# EAGLE design tranc_3b (EAGLE 6.5.0)
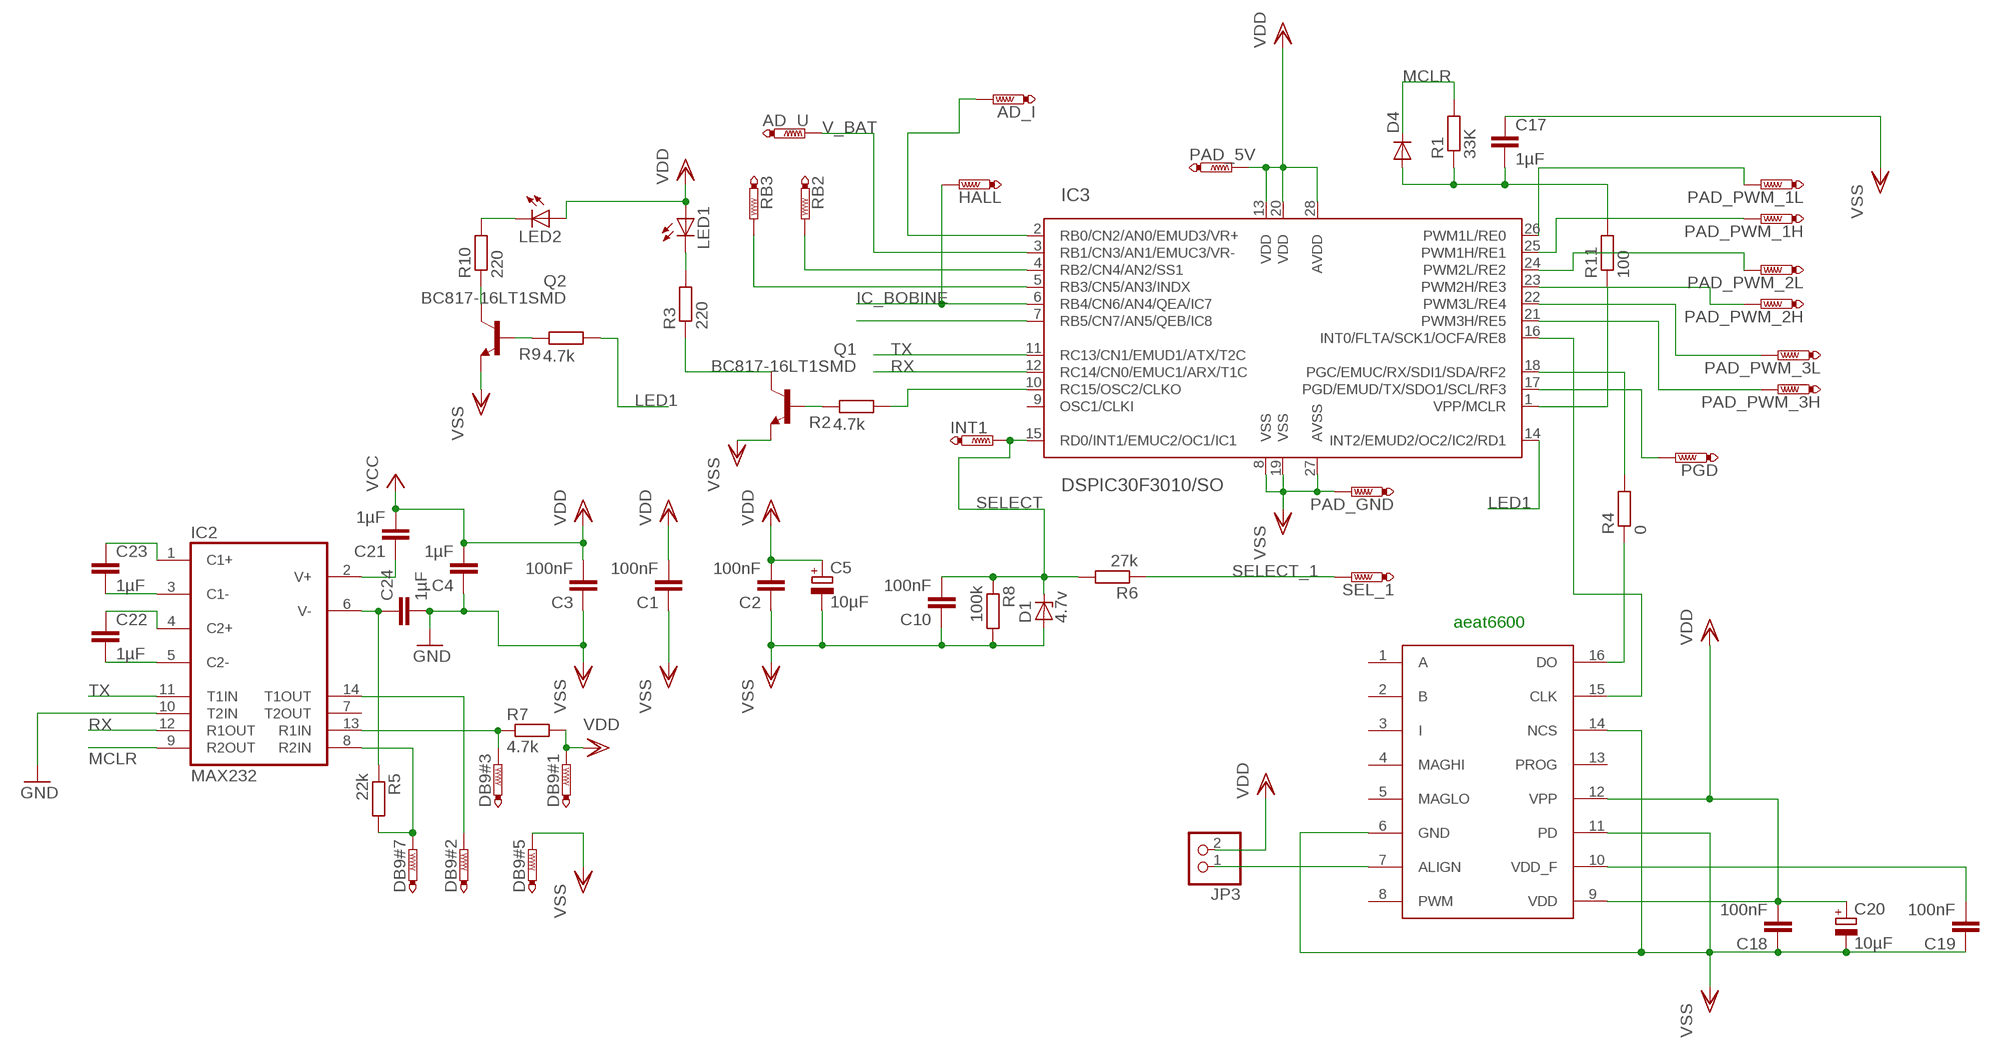
[diagram p0: schematic, sheet 1]

## Parts
AD_I  PTR1TP20SQ  [TP20SQ]
AD_U  PTR1TP20SQ  [TP20SQ]
C1  100nF  C-EUC0805K  [C0805K]
C2  100nF  C-EUC0805K  [C0805K]
C3  100nF  C-EUC0805K  [C0805K]
C4  1µF  C-EUC0805K  [C0805K]
C5  10µF  CPOL-EUSMCB  [SMC_B]
C10  100nF  C-EUC0805K  [C0805K]
C17  1µF  C-EUC0805K  [C0805K]
C18  100nF  C-EUC0805K  [C0805K]
C19  100nF  C-EUC0805K  [C0805K]
C20  10µF  CPOL-EUSMCB  [SMC_B]
C21  1µF  C-EUC0805K  [C0805K]
C22  1µF  C-EUC0805K  [C0805K]
C23  1µF  C-EUC0805K  [C0805K]
C24  1µF  C-EUC0805K  [C0805K]
D1  4.7v  ZENER-DIODESOD80C  [SOD80C]
D4  DIODE-MINIMELF  [MINIMELF]
DB9#1  PTR1TP20SQ  [TP20SQ]
DB9#2  PTR1TP20SQ  [TP20SQ]
DB9#3  PTR1TP20SQ  [TP20SQ]
DB9#5  PTR1TP20SQ  [TP20SQ]
DB9#7  PTR1TP20SQ  [TP20SQ]
HALL  PTR1TP20SQ  [TP20SQ]
IC2  MAX232  [SO16]
IC3  DSPIC30F3010/SO  [SO-28W]
INT1  PTR1TP16SQ  [TP16SQ]
JP3  PINHD-1X2  [1X02]
LED1  LEDCHIPLED_1206  [CHIPLED_1206]
LED2  LEDCHIPLED_1206  [CHIPLED_1206]
PAD_5V  PTR1TP20SQ  [TP20SQ]
PAD_GND  PTR1TP20SQ  [TP20SQ]
PAD_PWM_1H  PTR1TP20SQ  [TP20SQ]
PAD_PWM_1L  PTR1TP20SQ  [TP20SQ]
PAD_PWM_2H  PTR1TP08R  [TP08R]
PAD_PWM_2L  PTR1TP08R  [TP08R]
PAD_PWM_3H  PTR1TP08R  [TP08R]
PAD_PWM_3L  PTR1TP08R  [TP08R]
PGD  PTR1TP10SQ  [TP10SQ]
Q1  BC817-16LT1SMD  [SOT23-BEC]
Q2  BC817-16LT1SMD  [SOT23-BEC]
R1  33K  R-EU_M1206  [M1206]
R2  4.7k  R-EU_M0805  [M0805]
R3  220  R-EU_M0805  [M0805]
R4  0  R-EU_R0805W  [R0805W]
R5  22k  R-EU_M1206  [M1206]
R6  27k  R-EU_M1206  [M1206]
R7  4.7k  R-EU_M1206  [M1206]
R8  100k  R-EU_M0805  [M0805]
R9  4.7k  R-EU_M0805  [M0805]
R10  220  R-EU_M0805  [M0805]
R11  100  R-EU_M0805  [M0805]
RB2  PTR1TP10SQ  [TP10SQ]
RB3  PTR1TP10SQ  [TP10SQ]
SEL_1  PTR1TP20SQ  [TP20SQ]
U$3  AVAGO_AEAT-6600TSSOP16  [AVAGO_TSSOP16]

## Nets
IC_BOBINE: HALL.TP IC3.6(RB4/CN6/AN4/QEA/IC7)
LED1: IC3.14(INT2/EMUD2/OC2/IC2/RD1) R9.1
MCLR: D4.C IC2.9(R2OUT) R1.2
MCLR1: IC3.1(VPP/MCLR) R11.1
N$1: R4.1 U$3.16(DO)
N$2: IC3.21(PWM3H/RE5) PAD_PWM_3H.TP
N$3: IC3.16(INT0/FLTA/SCK1/OCFA/RE8) U$3.15(CLK)
N$4: IC3.22(PWM3L/RE4) PAD_PWM_3L.TP
N$5: Q1.B R2.2
N$6: Q1.C R3.1
N$7: IC3.7(RB5/CN7/AN5/QEB/IC8)
N$9: C17.2 D4.A R1.1 R11.2
N$10: IC3.23(PWM2H/RE3) PAD_PWM_2H.TP
N$11: IC3.25(PWM1H/RE1) PAD_PWM_1H.TP
N$12: IC3.26(PWM1L/RE0) PAD_PWM_1L.TP
N$13: IC3.24(PWM2L/RE2) PAD_PWM_2L.TP
N$14: JP3.1 U$3.7(ALIGN)
N$15: IC3.17(PGD/EMUD/TX/SDO1/SCL/RF3) PGD.TP
N$17: IC3.18(PGC/EMUC/RX/SDI1/SDA/RF2) R4.2
N$18: IC3.10(RC15/OSC2/CLKO) R2.1
N$19: IC3.5(RB3/CN5/AN3/INDX) RB3.TP
N$20: IC3.4(RB2/CN4/AN2/SS1) RB2.TP
N$21: Q2.B R9.2
N$22: Q2.C R10.1
N$23: LED1.C R3.2
N$24: LED2.C R10.2
N$27: C23.1 IC2.1(C1+)
N$28: C23.2 IC2.3(C1-)
N$29: C22.2 IC2.5(C2-)
N$30: AD_I.TP IC3.2(RB0/CN2/AN0/EMUD3/VR+)
N$31: C19.2 U$3.10(VDD_F)
N$32: C22.1 IC2.4(C2+)
N$33: C21.1 IC2.2(V+)
N$34: C24.1 IC2.6(V-) R5.1
N$35: DB9#3.TP IC2.13(R1IN) R7.1
N$36: DB9#2.TP IC2.14(T1OUT)
N$37: DB9#7.TP IC2.8(R2IN) R5.2
RX: IC2.12(R1OUT) IC3.12(RC14/CN0/EMUC1/ARX/T1C)
SELECT: C10.2 D1.C IC3.15(RD0/INT1/EMUC2/OC1/IC1) INT1.TP R6.2 R8.1
SELECT_1: R6.1 SEL_1.TP
TX: IC2.11(T1IN) IC3.11(RC13/CN1/EMUD1/ATX/T2C)
V_BAT: AD_U.TP IC3.3(RB1/CN3/AN1/EMUC3/VR-)
VDD: C1.2 C2.2 C3.2 C4.2 C5.+ C18.2 C20.+ C21.2 DB9#1.TP IC3.13(VDD) IC3.20(VDD) IC3.28(AVDD) JP3.2 LED1.A LED2.A PAD_5V.TP R7.2 U$3.9(VDD) U$3.12(VPP) ; supply symbol labelled VCC
VSS: C1.1 C2.1 C3.1 C4.1 C5.- C10.1 C17.1 C18.1 C19.1 C20.- C24.2 D1.A DB9#5.TP IC2.10(T2IN) IC3.8(VSS) IC3.19(VSS) IC3.27(AVSS) PAD_GND.TP Q1.E Q2.E R8.2 U$3.6(GND) U$3.11(PD) U$3.14(NCS) ; supply symbol labelled GND
Unconnected: IC2.7(T2OUT) IC3.9(OSC1/CLKI) U$3.1(A) U$3.2(B) U$3.3(I) U$3.4(MAGHI) U$3.5(MAGLO) U$3.8(PWM) U$3.13(PROG)

## Notes on the sheet
- aeat6600

## Power pins joined to a net without a drawn wire
VDD: IC2.16(VCC)
VSS: IC2.15(GND)

## Library data of the parts
AD_I AD_U DB9#1-DB9#3 DB9#5 DB9#7 HALL INT1 PAD_5V PAD_GND PAD_PWM_1H PAD_PWM_1L PAD_PWM_2H PAD_PWM_2L PAD_PWM_3H PAD_PWM_3L PGD RB2 RB3 SEL_1 = testpad:PTR1: TEST PIN
C1-C4 C10 C17-C19 C21-C24 = rcl:C-EU: CAPACITOR, European symbol
C5 C20 = rcl:CPOL-EU: POLARIZED CAPACITOR, European symbol
D1 = diode:ZENER-DIODE: Z-Diode
D4 = diode:DIODE-: DIODE
IC2 = maxim:MAX232: RS232 TRANSCEIVER
IC3 = microchip-dspic:DSPIC30F3010: dsPIC Motion Controller DSC
JP3 = pinhead:PINHD-1X2: PIN HEADER
LED1 LED2 = led:LED: LED OSRAM: - CHIPLED LG R971, LG N971, LY N971, LG Q971, LY Q971, LO R971, LY R971 LH N974, LH R974 LS Q976, LO Q976, LY Q976 LO Q996 - Hyper CHIPLED LW Q18S LB Q993, LB Q99A, LB R99A - SideLED LS A670, LO A670, LY A670, LG A670, LP A670 LB A673, LV A673, LT A673, LW A673 LH A674 LY A675 LS A676, LA A676, LO A676, LY A676, LW A676 LS A679, LY A679, LG A679 - Hyper Micro SIDELED® LS Y876, LA Y876, LO Y876, LY Y876 LT Y87S - SmartLED LW L88C, LW L88S LB L89C, LB L89S, LG L890 LS L89K, LO L89K, LY L89K LS L896, LA L896, LO L896, LY L896 - TOPLED LS T670, LO T670, LY T670, LG T670, LP T670 LSG T670, LSP T670, LSY T670, LOP T670, LYG T670 LG T671, LOG T671, LSG T671 LB T673, LV T673, LT T673, LW T673 LH T674 LS T676, LA T676, LO T676, LY T676, LB T676, LH T676, LSB T676, LW T676 LB T67C, LV T67C, LT T67C, LS T67K, LO T67K, LY T67K, LW E67C LS E67B, LA E67B, LO E67B, LY E67B, LB E67C, LV E67C, LT E67C LW T67C LS T679, LY T679, LG T679 LS T770, LO T770, LY T770, LG T770, LP T770 LB T773, LV T773, LT T773, LW T773 LH T774 LS E675, LA E675, LY E675, LS T675 LS T776, LA T776, LO T776, LY T776, LB T776 LHGB T686 LT T68C, LB T68C - Hyper Mini TOPLED® LB M676 - Mini TOPLED Santana® LG M470 LS M47K, LO M47K, LY M47K Source: http://www.osram.convergy.de LUXEON: - LUMILED® LXK2-PW12-R00, LXK2-PW12-S00, LXK2-PW14-U00, LXK2-PW14-V00 LXK2-PM12-R00, LXK2-PM12-S00, LXK2-PM14-U00 LXK2-PE12-Q00, LXK2-PE12-R00, LXK2-PE12-S00, LXK2-PE14-T00, LXK2-PE14-U00 LXK2-PB12-K00, LXK2-PB12-L00, LXK2-PB12-M00, LXK2-PB14-N00, LXK2-PB14-P00, LXK2-PB14-Q00 LXK2-PR12-L00, LXK2-PR12-M00, LXK2-PR14-Q00, LXK2-PR14-R00 LXK2-PD12-Q00, LXK2-PD12-R00, LXK2-PD12-S00 LXK2-PH12-R00, LXK2-PH12-S00 LXK2-PL12-P00, LXK2-PL12-Q00, LXK2-PL12-R00 Source: www.luxeon.com KINGBRIGHT: KA-3528ASYC Source: www.kingbright.com
Q1 Q2 = transistor-npn:BC817*: NPN Transistor
R1-R11 = rcl:R-EU_: RESISTOR, European symbol
U$3 = aeat_6600_1:AVAGO_AEAT-6600

## Board
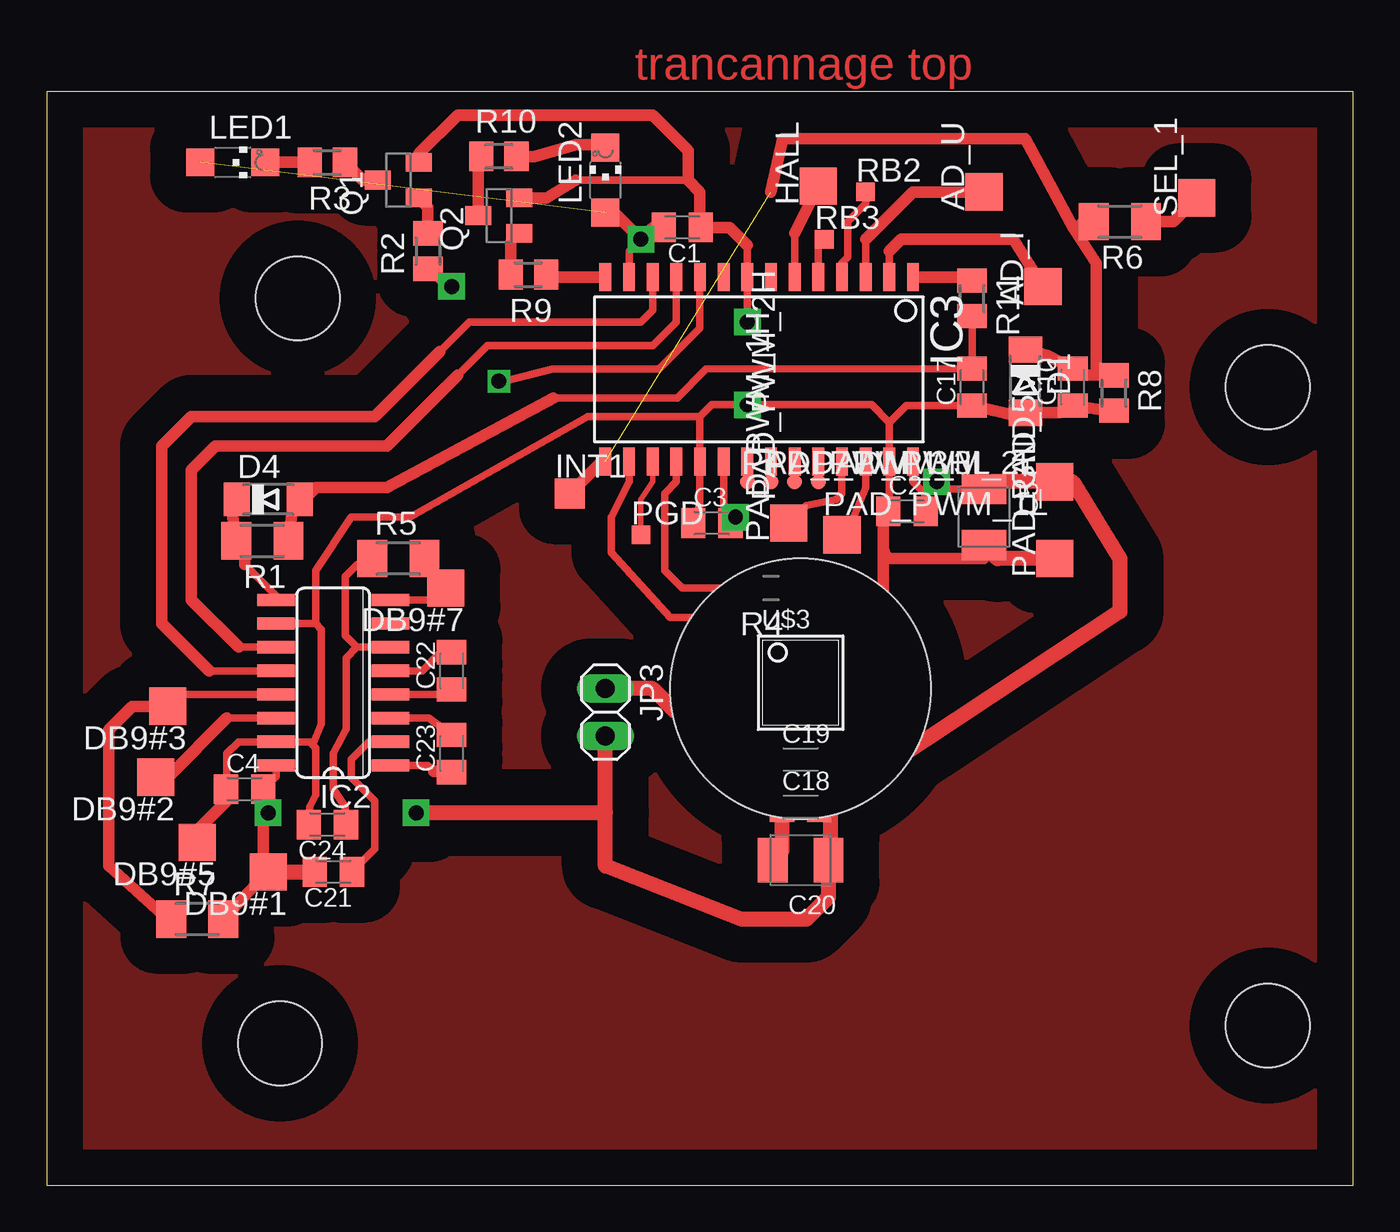
[diagram p1: board, top side]
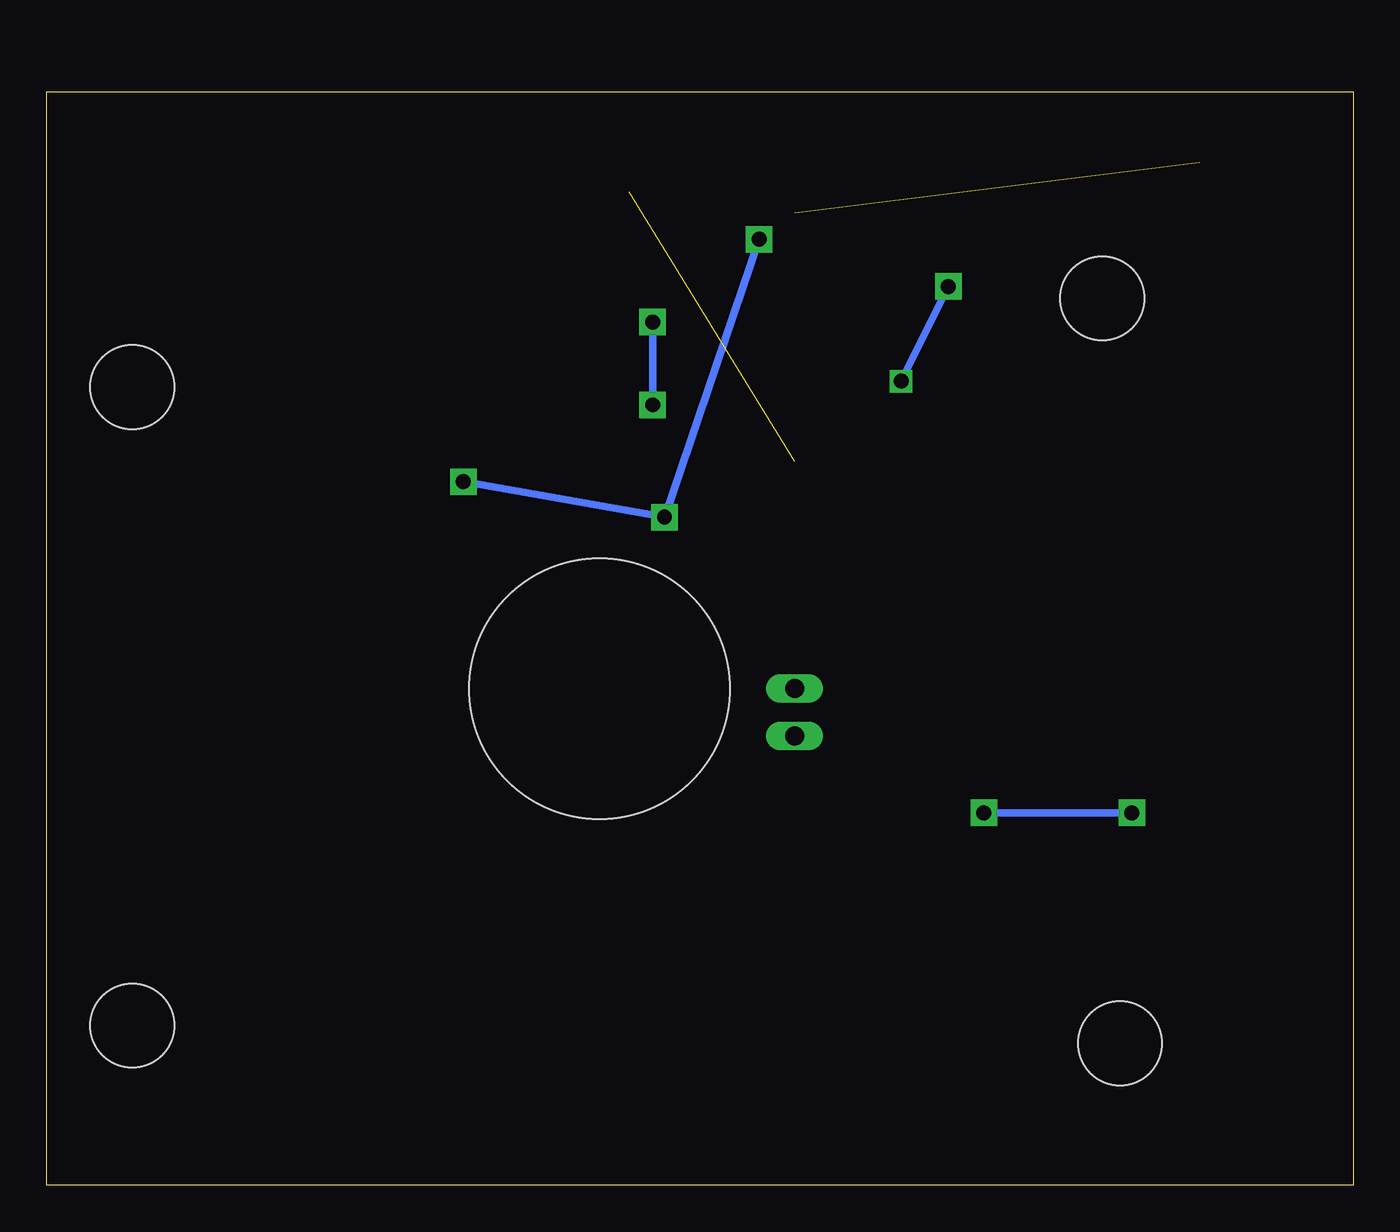
[diagram p2: board, bottom side, seen from below]

Size 70.16 x 58.73 mm. Coordinates in mm from the lower left corner, seen from the top.
Outline: 0,0 70.16,0 70.16,58.73 0,58.73 0,0
Copper layers (1*16): Top 0.035mm / dielectric 1.5mm / Bottom 0.035mm
Design rules "default": minimum track width 10mil, minimum drill 24mil, track to track 8mil, track to pad 8mil, pad to pad 8mil, via to via 8mil, smd to smd 8mil, copper to edge 40mil, drill to drill 8mil, minimum pad ring 10mil, minimum via ring 8mil, stop-mask expansion 4mil, vias tented up to drill 0mil, thermal gap 10mil
Holes 14 mm at 40.48,26.66
Holes 4.5 mm at 13.49,47.62 65.56,42.86 12.54,7.62 65.56,8.57

### Footprints (pad centres in the part's own frame; a part is rotated, then mirrored left to right if it is on the bottom)
TP20SQ = smd 2 x 2: TP 0,0
C0805K = smd 1.3 x 1.6: 1 -1,0; 2 1,0
SMC_B = smd 1.6 x 2.4: + -1.5,0; - 1.5,0
SOD80C = smd 1.4 x 1.8: A 1.7,0; C -1.7,0
MINIMELF = smd 1.4 x 1.8: A 1.7,0; C -1.7,0
SO16 = smd 0.66 x 2.032: 1 -4.445,-3.073; 2 -3.175,-3.073; 3 -1.905,-3.073; 4 -0.635,-3.073; 5 0.635,-3.073; 6 1.905,-3.073; 7 3.175,-3.073; 8 4.445,-3.073; 9 4.445,3.073; 10 3.175,3.073; 11 1.905,3.073; 12 0.635,3.073; 13 -0.635,3.073; 14 -1.905,3.073; 15 -3.175,3.073; 16 -4.445,3.073
SO-28W = smd 0.635 x 1.524: 1 -7.62,-4.953; 2 -6.35,-4.953; 3 -5.08,-4.953; 4 -3.81,-4.953; 5 -2.54,-4.953; 6 -1.27,-4.953; 7 0,-4.953; 8 1.27,-4.953; 9 2.54,-4.953; 10 3.81,-4.953; 11 5.08,-4.953; 12 6.35,-4.953; 13 7.62,-4.953; 14 8.89,-4.953; 15 8.89,4.953; 16 7.62,4.953; 17 6.35,4.953; 18 5.08,4.953; 19 3.81,4.953; 20 2.54,4.953; 21 1.27,4.953; 22 0,4.953; 23 -1.27,4.953; 24 -2.54,4.953; 25 -3.81,4.953; 26 -5.08,4.953; 27 -6.35,4.953; 28 -7.62,4.953
TP16SQ = smd 1.6 x 1.6: TP 0,0
1X02 = drill 1.016 long: 1 -1.27,0; 2 1.27,0
CHIPLED_1206 = smd 1.5 x 1.5: A 0,-1.75; C 0,1.75
TP08R = smd 0.8 x 0.8: TP 0,0
TP10SQ = smd 1 x 1: TP 0,0
SOT23-BEC = smd 1 x 1.4: B -0.95,-1.1; C 0,1.1; E 0.95,-1.1
M1206 = smd 1.6 x 2: 1 -1.4,0; 2 1.4,0
M0805 = smd 1.3 x 1.6: 1 -0.95,0; 2 0.95,0
R0805W = smd 1.5 x 1: 1 -1.052,0; 2 1.052,0
AVAGO_TSSOP16 = smd 0.305 x 0.991: 1 -2.275,-2.918; 2 -1.625,-2.918; 3 -0.975,-2.918; 4 -0.325,-2.918; 5 0.325,-2.918; 6 0.975,-2.918; 7 1.625,-2.918; 8 2.275,-2.918; 9 2.275,2.918; 10 1.625,2.918; 11 0.975,2.918; 12 0.325,2.918; 13 -0.325,2.918; 14 -0.975,2.918; 15 -1.625,2.918; 16 -2.275,2.918

### Placement (x,y rotation side)
AD_I  53.49,48.26 90 top
AD_U  50.32,53.34 90 top
C1  34.12,51.43 180 top
C2  46.19,36.19 0 top
C3  35.71,35.55 0 top
C4  10.63,21.27 0 top
C5  50.32,35.87 270 top
C10  55.08,42.86 90 top
C17  49.68,42.86 90 top
C18  40.48,20.32 0 top
C19  40.48,22.86 0 top
C20  40.48,17.46 180 top
C21  15.39,16.82 180 top
C22  21.74,27.62 90 top
C23  21.74,23.17 90 top
C24  15.08,19.36 180 top
D1  52.54,43.17 270 top
D4  11.9,36.83 0 top
DB9#1  11.9,16.82 180 top
DB9#2  5.87,21.9 180 top
DB9#3  6.5,25.71 180 top
DB9#5  8.09,18.41 180 top
DB9#7  21.42,32.06 180 top
HALL  41.43,53.65 90 top
IC2  15.39,26.98 90 top
IC3  38.89,43.81 180 top
INT1  28.09,37.14 0 top
JP3  30,25.39 270 top
LED1  10,54.92 270 top
LED2  30,53.97 0 top
PAD_5V  54.13,37.78 90 top
PAD_GND  54.13,33.65 90 top
PAD_PWM_1H  39.84,35.55 90 top
PAD_PWM_1L  42.7,34.92 0 top
PAD_PWM_2H  40.16,37.78 90 top
PAD_PWM_2L  41.43,37.78 0 top
PAD_PWM_3H  37.62,37.78 0 top
PAD_PWM_3L  38.89,37.78 0 top
PGD  31.9,34.92 0 top
Q1  18.88,53.97 90 top
Q2  24.28,52.06 90 top
R1  11.58,34.6 180 top
R2  20.47,50.16 90 top
R3  15.08,54.92 180 top
R4  38.89,32.06 180 top
R5  18.88,33.65 0 top
R6  57.62,51.75 180 top
R7  8.09,14.28 0 top
R8  57.3,42.54 270 top
R9  25.87,48.89 180 top
R10  24.28,55.24 0 top
R11  49.68,47.62 270 top
RB2  43.97,53.34 0 top
RB3  41.74,50.8 0 top
SEL_1  61.75,53.02 90 top
U$3  40.48,26.98 270 top

### Tracks (layer width: path | path; a pad name or v marks a point on that pad's centre or on a via)
IC_BOBINE
  Top 0.406: IC3.6 40.16,51.11
  Top 0.61: 40.16,51.11 HALL.TP
LED1
  Top 0.61: IC3.14 26.95,48.76 R9.1
MCLR
  Top 0.406: 10,35.88 10,36.83 10,36.62 D4.C | IC2.9 12.32,31.64 10.63,33.33 | 10.63,34.6 R1.2
  Top 0.61: R1.2 10,35.88 | 10.63,33.33 10.63,34.6
MCLR1
  Top 0.406: 49.49,48.76 R11.1
  Top 0.61: IC3.1 49.49,48.76
N$1
  Top 0.406: R4.1 40.59,32.06 U$3.16
N$2
  Top 0.406: PAD_PWM_3H.TP IC3.21
N$3
  Top 0.254: U$3.15 41.07,28.61 40.79,28.89
  Top 0.406: 40.79,28.89 39.2,30.48 33.49,30.48 30.31,33.97 30.31,35.87 31.27,37.78 IC3.16
N$4
  Top 0.406: PAD_PWM_3L.TP IC3.22
N$5
  Top 0.61: R2.2 20.47,52.53 Q1.B
N$6
  Top 0.61: Q1.C 16.98,53.97 R3.1
N$8
  pour Top (isolate 1.93): 0.47,58.73 70.32,58.73 70.32,0.31 0.15,0.31
N$9
  Top 0.406: R11.2 C17.2 35.39,43.81 33.85,42.27 27.19,42.27 | 12.58,34.65 R1.1 | 13.17,35.99 D4.A 13.81,36.83
  Top 0.61: R1.1 13.17,35.99 | 27.19,42.27 18.25,37.46 14.44,37.46 13.81,36.83
N$10
  Top 0.406: PAD_PWM_2H.TP IC3.23
N$11
  Top 0.406: IC3.25 42.7,37.14 42.38,36.83 40.79,36.51 PAD_PWM_1H.TP
N$12
  Top 0.406: IC3.26 43.97,37.46 43.33,35.87 PAD_PWM_1L.TP
N$13
  Top 0.406: PAD_PWM_2L.TP IC3.24
N$14
  Top 0.254: U$3.7 35.43,25.36 35.39,25.39
  Top 0.406: 35.39,25.39 33.81,25.39
  Top 0.813: 33.81,25.39 32.54,26.66 JP3.1
N$15
  Top 0.305: IC3.17 32.54,37.78 31.9,36.83 PGD.TP 31.9,34.6
N$17
  Top 0.406: R4.2 34.12,32.06 33.17,33.02 33.17,37.14 33.81,37.78 IC3.18
N$18  (via drill 0.8, 0.8 pad 1.42)
  Top 0.406: IC3.10 35.08,46.03 32.85,43.81 27.14,43.81 24.6,43.17 v24.28,43.17 | v21.74,48.26 21.43,48.26 R2.1
  Bottom 0.406: v24.28,43.17 v21.74,48.26
N$19
  Top 0.406: IC3.5 41.43,50.48 RB3.TP
N$20
  Top 0.406: IC3.4 42.7,49.52 43.02,49.84 43.02,51.75 43.97,52.7 RB2.TP
N$21
  Top 0.406: 24.92,50.65 Q2.B
  Top 0.61: R9.2 24.92,50.65
N$22
  Top 0.406: 23.18,55.09 R10.1
  Top 0.61: Q2.C 23.18,55.09
N$23
  Top 0.61: R3.2 LED1.C
N$24
  Top 0.406: 29.84,55.88 LED2.C
  Top 0.61: R10.2 26.19,55.24 28.41,55.88 29.84,55.88
N$27
  Top 0.406: IC2.1 20.47,22.54 20.79,22.22 | 22.01,22.22 C23.1
  Top 0.61: 20.79,22.22 22.01,22.22
N$28
  Top 0.406: IC2.3 20.52,25.08 C23.2
N$29
  Top 0.406: IC2.5 20.15,27.62 21.11,28.57 22.01,28.57 C22.2
N$30
  Top 0.406: IC3.2 45.24,50.16
  Top 0.61: 45.24,50.16 45.87,50.8 51.91,50.8 AD_I.TP
N$31
  Top 0.254: U$3.10 42.34,25.36 41.43,24.44
  Top 0.406: 41.43,24.44 41.43,22.9 C19.2
N$32
  Top 0.406: IC2.4 22.06,26.35 C22.1
N$33
  Top 0.406: 16.34,16.77 C21.1 17.61,18.05 17.61,20.63 16.34,21.9 16.34,22.86 17.3,23.81 IC2.2
N$34
  Top 0.406: C24.1 16.03,20.32 15.39,21.27 15.39,23.17 16.07,24.49 16.07,28.3 16.66,28.89 | 16.66,28.89 IC2.6 | R5.1 16.66,33.34 16.03,32.7 16.03,29.52 16.66,28.89
N$35
  Top 0.406: IC2.13 7.14,26.35 DB9#3.TP
  Top 0.61: R7.1 6.5,14.28 3.33,17.14 3.33,24.44 4.6,25.71 DB9#3.TP
N$36
  Top 0.406: IC2.14 9.68,25.08 | 6.5,21.9 DB9#2.TP
  Top 0.61: 9.68,25.08 6.5,21.9
N$37
  Top 0.406: IC2.8 21.42,31.43 DB9#7.TP 20.29,33.2 R5.2
RX
  Top 0.406: IC2.12 8.73,27.62 | 21.11,44.76 22.7,46.35 31.9,46.35 32.54,46.98 IC3.12
  Top 0.61: 8.73,27.62 6.18,30.16 6.18,39.68 7.77,41.27 17.61,41.27 21.11,44.76
SELECT  (1 unrouted)
  Top 0.406: 55.4,43.49 54.81,43.49 C10.2 | R6.2 55.52,51.75 55.13,51.36
  Top 0.61: R8.1 56.35,43.49 | 56.35,43.49 55.4,43.49 | D1.C 53.74,44.56 C10.2 | 38.89,53.34 39.52,56.19 52.54,56.19 55.13,51.36 56.35,49.52 56.35,43.49 | IC3.15 29.81,38.86 INT1.TP
SELECT_1
  Top 0.61: R6.1 60.48,51.75 SEL_1.TP
TX
  Top 0.406: IC3.11 33.81,46.35 32.54,45.08 23.65,45.08 22.06,43.49 | 10.31,28.89 IC2.11
  Top 0.61: 22.06,43.49 18.25,39.68 9.04,39.68 7.77,38.41 7.77,31.43 10.31,28.89
V_BAT
  Top 0.406: IC3.3 43.97,50.8
  Top 0.61: 43.97,50.8 46.51,53.34 AD_U.TP
VDD  (via drill 0.8 pad 1.42)  (1 unrouted)
  Top 0.254: U$3.9 43.97,24.71 44.55,24.71 44.92,25.08 44.92,26.35 44.6,26.66 U$3.12
  Top 0.406: IC2.16 12.32,21.96 C4.2 11.63,20.32 11.95,20 v11.9,20 | 11.63,17.09 DB9#1.TP | C18.2 42.06,20.63 | 43.49,21.43 43.65,21.59 43.65,24.39 43.97,24.71 | IC3.20 36.35,36.55 C3.2 v36.98,35.87 | 42.06,17.86 C20.+ | 32.54,51.43 C1.2 | 50.72,37.78 C5.+ 47.78,37.37 | IC3.13 31.27,50.16 v31.9,50.8 | IC3.28 46.51,37.78 47.14,37.14 | 47.14,37.14 47.14,36.24 C2.2 | 47.78,37.37 47.37,37.37 47.14,37.14 | v47.78,37.78 47.78,37.37 | PAD_5V.TP 55.08,37.78
  Top 0.61: 11.63,20.32 11.63,17.09 | 32.54,51.43 v31.9,50.8 30.16,52.54 LED2.A | R7.2 11.26,16.18 DB9#1.TP
  Top 0.813: DB9#1.TP C21.2 | 43.49,21.43 42.06,20.63 42.06,17.86 | PAD_5V.TP 50.72,37.78 | C20.+ 41.98,15.46 40.79,14.28 37.3,14.28 30,17.14 30,20 | 30,20 JP3.2 | 30,20 v19.84,20 | 55.08,37.78 57.62,33.65 57.62,30.79 43.65,21.59
  Bottom 0.406: v19.84,20 v11.9,20 | v31.9,50.8 v36.98,35.87 v47.78,37.78
VSS  (via drill 0.8 pad 1.42)
  Top 0.254: U$3.11 41.43,26.01 | 41.43,26.01 39.84,26.01 U$3.6 | 41.43,26.01 41.43,27.3 42.09,27.96 U$3.14 44.62,27.96 44.92,28.25
  Top 0.406: 9.63,20.59 C4.1 9.68,21.32 9.68,23.17 10.31,23.81 IC2.15 14.12,23.81 14.28,23.65 | 7.46,18.41 DB9#5.TP | 14.28,23.65 14.44,23.49 14.44,20.95 14.12,20.32 14.12,19.41 C24.2 | IC2.10 14.44,30.16 | 14.28,23.65 14.76,24.76 14.76,29.84 14.44,30.16 | 39.84,26.01 39.48,25.64 C19.1 C18.1 | C3.1 35.08,36.55 IC3.19 35.08,41.27 | C17.1 46.14,41.86 45.24,40.95 | 45.24,40.95 IC3.27 45.24,36.24 C2.1 44.92,35.92 | 35.08,41.27 35.71,41.91 v37.62,41.91 44.28,41.91 45.24,40.95 | 39.48,17.96 C20.- | 35.08,41.27 35.07,41.27 29.04,41.27 19.52,35.87 16.34,35.87 14.44,33.02 14.44,30.16 | 37.62,50.48 IC3.8 v37.62,46.35 | 52.48,41.22 D1.A | 54.38,41.48 C10.1 | 57.25,41.54 R8.2 | 45.15,33.74 44.92,34.6 | 28.41,53.97 34.44,53.97 | 35.08,51.48 C1.1
  Top 0.61: 9.63,20.59 7.46,18.41 | 44.92,28.25 44.92,34.6 44.92,35.92 | 37.62,50.48 36.66,51.43 C1.1 | C17.1 52.48,41.22 | D1.A 54.38,41.48 | C10.1 57.25,41.54 | C5.- 50.32,33.65 44.92,33.65 45.01,33.74 45.15,33.74 | Q2.E 26.82,53.02 28.41,53.97 | 35.08,51.48 35.08,53.34 34.44,53.97 34.44,55.56 32.54,57.46 22.06,57.46 19.98,55.39 Q1.E
  Top 0.813: C18.1 39.48,17.96 | PAD_GND.TP 51.04,33.65 C5.-
  Bottom 0.406: v37.62,41.91 v37.62,46.35

### Text on the board
Top: trancannage top